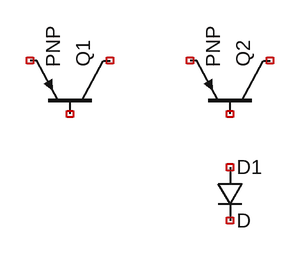
[diagram p0: schematic Draft1.asc]
Draft1.asc, the LTspice schematic file:
Version 4
SHEET 1 880 680
SYMBOL pnp 80 -96 M270
SYMATTR InstName Q1
SYMBOL pnp 272 -96 M270
SYMATTR InstName Q2
SYMBOL diode 208 -32 R0
SYMATTR InstName D1

The netlist it stands for:
* Draft1.asc
Q1 NC_01 NC_02 NC_03 0 PNP
Q2 NC_04 NC_05 NC_06 0 PNP
D1 NC_07 NC_08 D
.model D D
.lib standard.dio
.model NPN NPN
.model PNP PNP
.lib standard.bjt
.backanno
.end